# Altium schematic sheet RS485_RS232_Sheet.SchDoc
size 420 x 297 mm; DocumentNumber: 5; SheetNumber: 5; SheetTotal: 14
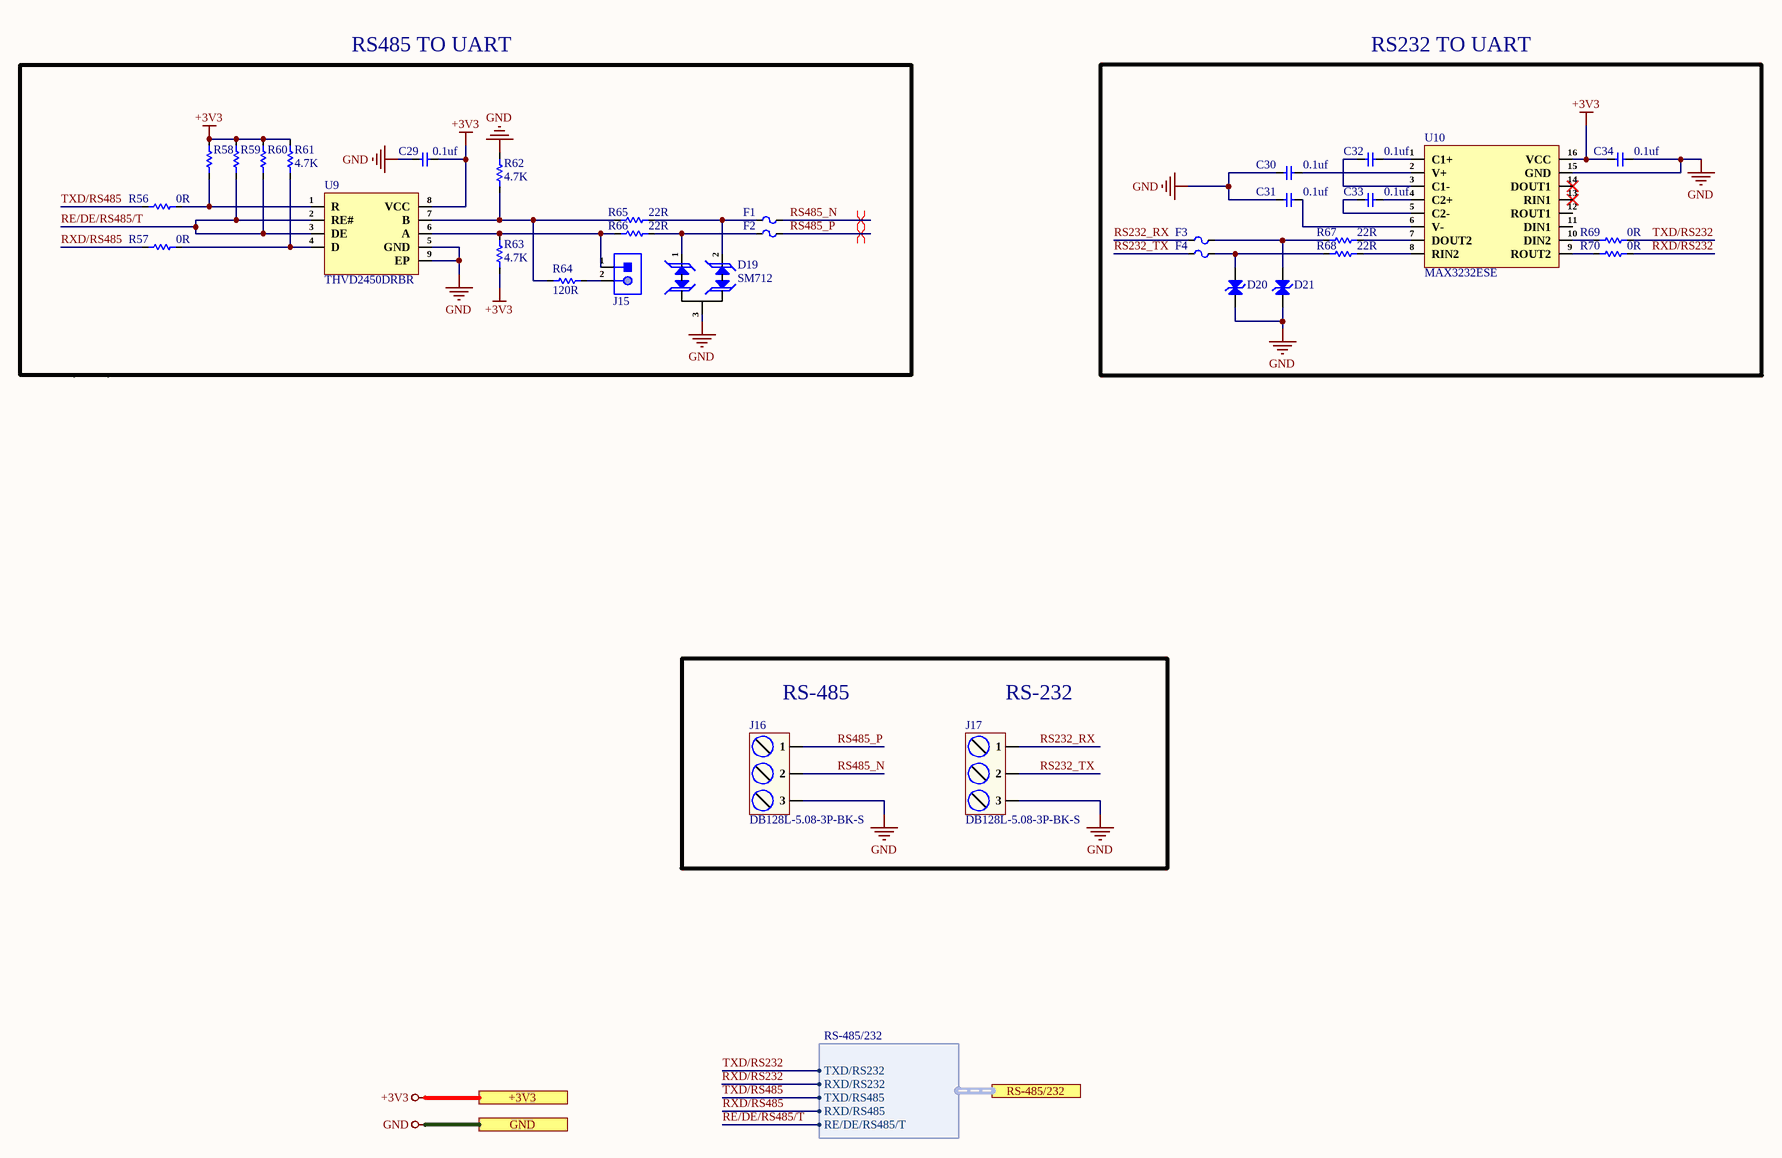
[diagram p0: RS485_RS232_Sheet.SchDoc]

## Parts
C29  0.1uf  [Cap-0402]
C30  0.1uf  [Cap-0402]
C31  0.1uf  [Cap-0402]
C32  0.1uf  [Cap-0402]
C33  0.1uf  [Cap-0402]
C34  0.1uf  [Cap-0402]
D19  SM712  [SOT-23]
D20  SMBJ8.0CA  [SMB Bi Directional]  (value not drawn)
D21  SMBJ8.0CA  [SMB Bi Directional]  (value not drawn)
F1  MF-MSMF010-2  [Fuse-1812_]  (value not drawn)
F2  MF-MSMF010-2  [Fuse-1812_]  (value not drawn)
F3  MF-MSMF010-2  [Fuse-1812_]  (value not drawn)
F4  MF-MSMF010-2  [Fuse-1812_]  (value not drawn)
J15  X6511WV-02H-C60D30  [HDR1X2_]  (value not drawn)
J16  DB128L-5.08-3P-BK-S  [DB128L-5.08-3P-BK-S]
J17  DB128L-5.08-3P-BK-S  [DB128L-5.08-3P-BK-S]
R56  0R  [Res-0402]
R57  0R  [Res-0402]
R58  4.7K  [Res-0402]  (value not drawn)
R59  4.7K  [Res-0402]  (value not drawn)
R60  4.7K  [Res-0402]  (value not drawn)
R61  4.7K  [Res-0402]
R62  4.7K  [Res-0402]
R63  4.7K  [Res-0402]
R64  120R  [Res-0603]
R65  22R  [Res-0201]
R66  22R  [Res-0201]
R67  22R  [Res-0201]
R68  22R  [Res-0201]
R69  0R  [Res-0402]
R70  0R  [Res-0402]
U9  THVD2450DRBR  [SON-8-EP(3x3)]
U10  MAX3232ESE  [SOP-16]

## Ports
+3V3 (see Top-Sheet[1B], CAN_Sheet[5D], Controller_Sheet[5D], EtherCAT_Sheet[5D], Power_Sheet[5D], Stepper_Driver_Sheet[5D]), GND (see Top-Sheet[1B], CAN_Sheet[5D], Controller_Sheet[5D], EtherCAT_Sheet[5D], Ext_Stepper_Driver_Sheet[5D], Power_Sheet[5D], Stepper_Driver_Sheet[5D]), RS-485/232 (harness RS-485/232, see Top-Sheet[2B], Controller_Sheet[4D])

## Harnesses
RS-485/232: TXD/RS232, RXD/RS232, TXD/RS485, RXD/RS485, RE/DE/RS485/T

## Nets
+3V3: C29.2 C34.2 R58.2 R59.2 R60.2 R61.2 R63.1 U9.8(VCC) U10.16(VCC) ; port +3V3
GND: C29.1 C30.1 C31.1 C34.1 D19.3(GND) D20.1(A) D21.1(A) J16.3 J17.3 R62.2 U9.5(GND) U9.9(EP) U10.15(GND) ; port GND
RE/DE/RS485/T: R59.1 R60.1 U9.2(RE#) U9.3(DE) ; port RS-485/232.RE/DE/RS485/T
RS232_RX: F3.1 J17.1
RS232_TX: F4.1 J17.2
RS485_N: F1.2 J16.2
RS485_P: F2.2 J16.1
RXD/RS232: R70.2 ; port RS-485/232.RXD/RS232
RXD/RS485: R57.1 ; port RS-485/232.RXD/RS485
TXD/RS232: R69.2 ; port RS-485/232.TXD/RS232
TXD/RS485: R56.1 ; port RS-485/232.TXD/RS485
NetC30_2: C30.2 U10.2(V+)
NetC31_2: C31.2 U10.6(V-)
NetC32_1: C32.1 U10.1(C1+)
NetC32_2: C32.2 U10.3(C1-)
NetC33_1: C33.1 U10.4(C2+)
NetC33_2: C33.2 U10.5(C2-)
NetD19_1: D19.1(I/O1) F2.1 R66.2
NetD19_2: D19.2(I/O2) F1.1 R65.2
NetD20_2: D20.2(A) F4.2 R68.1
NetD21_2: D21.2(A) F3.2 R67.1
NetJ15_1: J15.1 R63.2 R66.1 U9.6(A)
NetJ15_2: J15.2 R64.2
NetR56_2: R56.2 R58.1 U9.1(R)
NetR57_2: R57.2 R61.1 U9.4(D)
NetR62_1: R62.1 R64.1 R65.1 U9.7(B)
NetR67_2: R67.2 U10.7(DOUT2)
NetR68_2: R68.2 U10.8(RIN2)
NetR69_1: R69.1 U10.10(DIN2)
NetR70_1: R70.1 U10.9(ROUT2)

Not connected (* = marked no-connect by the designer): U10 11(DIN1) 12(ROUT1) 13(RIN1)* 14(DOUT1)*

## Layout directives
differential pair; net class RS485; differential pair class RS485_LINES; rule Impedance Constraint [Min = 115.0    Max = 125.0    ]; rule Matched Net Lengths [Tolerance = 0.508mm]: RS485_N, RS485_P

## Notes on the sheet
- RS485 TO UART
- RS232 TO UART
- (near J16) RS-485
- (near J17) RS-232
- File:
- Title:
- Date:
- Page
- Num:
- Total:
- Drawn By: Huzaifa Ali

## Library data of the parts
C29-C34 = GRM155R62A104KE14D: CAP CER 0.1UF 100V X5R 0402; Manufacturer: Murata; Capacitance: 100nF; Tolerance: 10%; Item Type: Capacitor; Supplier 1: Arrow Electronics; Manufacturer Part Number: GRM155R62A104KE14D; RoHS: Yes; Category: Ceramic Capacitors; Stock 1: 870000; Pricing 1: 10000=0.00500, 20000=0.00410, 30000=0.00390, 50000=0.00370, 100000=0.00300 (USD); Mount: Surface Mount; Case/Package: 0402; Case Code (Metric): 1005; Case Code (Imperial): 0402; Weight: 0.000212oz; Min Operating Temperature: -55°C; Max Operating Temperature: 85°C; Packaging: Tape and Reel; Voltage Rating: 100V; Dielectric: X5R; Termination: SMD/SMT; Voltage Rating (DC): 100V; Package Quantity: 10000; Series: GRM; Length: 0.039inch; Width: 0.02inch; Height: 0.5mm; Thickness: 0.022inch; Reach SVHC Compliant: Yes; Lead Free: Lead Free; RoHS Compliant: Yes; ComponentLink1URL: http://www.farnell.com/datasheets/2079151.pdf?src-supplier=Farnell; ComponentLink1Description: http://www.farnell.com/datasheets/2079151.pdf?src-supplier=Farnell; ComponentLink2URL: http://www.mouser.com/ds/2/281/c02e-2905.pdf?src-supplier=Mouser; ComponentLink2Description: http://www.mouser.com/ds/2/281/c02e-2905.pdf?src-supplier=Mouser; ComponentLink3URL: http://www.farnell.com/datasheets/2079151.pdf?src-supplier=Element14; ComponentLink3Description: http://www.farnell.com/datasheets/2079151.pdf?src-supplier=Element14; ComponentLink4URL: http://search.murata.co.jp/Ceramy/image/img/A01X/G101/ENG/GRM155R62A104KE14-01.pdf?src-supplier=Digi-Key; ComponentLink4Description: http://search.murata.co.jp/Ceramy/image/img/A01X/G101/ENG/GRM155R62A104KE14-01.pdf?src-supplier=Digi-Key; ComponentLink5URL: http://www.farnell.com/datasheets/2079151.pdf?src-supplier=Newark; ComponentLink5Description: http://www.farnell.com/datasheets/2079151.pdf?src-supplier=Newark; Supplier Part Number 1: GRM155R62A104KE14D; LCSC Part Number: C162178
D19 = SM712: SOT-23 TVS ROHS; Manufacturer: TECH PUBLIC; Item Type: Diode; Manufacturer Part Number: SM712; Package: SOT-23; LCSC Part Number: C521963; ComponentLink1Description: LCSC; ComponentLink1URL: https://www.lcsc.com/product-detail/TVS_TECH-PUBLIC-SM712_C521963.html
D20 D21 = SMBJ8.0CA: TVS DIODE 8VWM 13.6VC DO214AA; Manufacturer: Littelfuse; Item Type: TVS Diodes; Peak Pulse Power: 600W; Clamping Voltage: 13.6V; Reverse Standoff Voltage: 8V; Peak Pulse Current: 44.2A; Test Current: 1mA; Polarity: Bidirectional; Number of Bidirectional Channels: 1; Min Breakdown Voltage: 8.89V; Power Line Protection: No; Leakage Current: 100uA; Diode Type: ZENER; Max Breakdown Voltage: 9.83V; Supplier: Digikey; LCSC Part Number: C224029; Manufacturer Part Number: SMBJ8.0CA; RoHS: Yes; Stock: 5825; Pricing: 1=0.52, 10=0.321, 100=0.2038, 500=0.15312, 1000=0.13674 (USD); Mounting Technology: Surface Mount; Case/Package: DO-214AA; Pins: 2; Min Operating Temperature: -65°C; Max Operating Temperature: 150°C; Packaging: Cut Tape; Reverse Breakdown Voltage: 8.89V; Number of Elements: 1; Series: SMBJ; Direction: Bidirectional; Voltage Rating (DC): 8V; Max Power Dissipation: 600W; Power Dissipation: 600W; Clamping Voltage-Max: 13.6V; Length: 5.59mm; Width: 3.94mm; Height: 2.44mm; RoHS Compliant: Yes; Lead Free: Lead Free; Reach SVHC Compliant: No; ComponentLink1URL: https://datasheet.ciiva.com/8062/littelfuse-tvs-diode-smbj-8062558.pdf?src-supplier=Element14; ComponentLink1Description: https://datasheet.ciiva.com/8062/littelfuse-tvs-diode-smbj-8062558.pdf?src-supplier=Element14; ComponentLink2URL: https://datasheet.ciiva.com/331/littelfuse-tvs-diode-smbj-datasheet-pdf-331629.pdf?src-supplier=Digikey; ComponentLink2Description: https://datasheet.ciiva.com/331/littelfuse-tvs-diode-smbj-datasheet-pdf-331629.pdf?src-supplier=Digikey; ComponentLink3URL: https://datasheet.ciiva.com/331/littelfuse-tvs-diode-smbj-datasheet-pdf-331630.pdf?src-supplier=Digikey; ComponentLink3Description: https://datasheet.ciiva.com/331/littelfuse-tvs-diode-smbj-datasheet-pdf-331630.pdf?src-supplier=Digikey; ComponentLink4URL: https://datasheet.ciiva.com/331/littelfuse-tvs-diode-smbj-datasheet-pdf-331628.pdf?src-supplier=Digikey; ComponentLink4Description: https://datasheet.ciiva.com/331/littelfuse-tvs-diode-smbj-datasheet-pdf-331628.pdf?src-supplier=Digikey
F1-F4 = MF-MSMF010-2: 60V 100mA 40A 300mA 1812 Resettable Fuses ROHS; Manufacturer: Bourns; Time to Trip: 1.5s; Item Type: Fuse; Supplier 1: Arrow Electronics; Manufacturer Part Number: MF-MSMF010-2; RoHS: Yes; Category: Fuses; Stock 1: 75000; Pricing 1: 3000=0.1392 (USD); Mounting Technology: Surface Mount; Case Code (Imperial): 1812; Case Code (Metric): 4532; Min Operating Temperature: -40°C; Max Operating Temperature: 85°C; Packaging: Cut Tape; Max Current Rating: 40A; Hold Current: 100mA; Trip Current: 300mA; Series: Multifuse®, MF-MSMF; Voltage Rating: 60V; Ratings: AEC-Q200; RoHS Compliant: Yes; ComponentLink1URL: http://www.farnell.com/datasheets/2264697.pdf?src-supplier=Farnell; ComponentLink1Description: http://www.farnell.com/datasheets/2264697.pdf?src-supplier=Farnell; ComponentLink2URL: http://www.farnell.com/datasheets/2264697.pdf?src-supplier=Newark; ComponentLink2Description: http://www.farnell.com/datasheets/2264697.pdf?src-supplier=Newark; ComponentLink3URL: http://www.farnell.com/datasheets/2264697.pdf?src-supplier=Element14; ComponentLink3Description: http://www.farnell.com/datasheets/2264697.pdf?src-supplier=Element14; ComponentLink4URL: http://www.farnell.com/datasheets/1786007.pdf?src-supplier=Newark; ComponentLink4Description: http://www.farnell.com/datasheets/1786007.pdf?src-supplier=Newark; ComponentLink5URL: https://www.bourns.com/docs/Product-Datasheets/mfmsmf.pdf?src-supplier=Digi-Key; ComponentLink5Description: https://www.bourns.com/docs/Product-Datasheets/mfmsmf.pdf?src-supplier=Digi-Key; Supplier Part Number 1: MF-MSMF010-2; LCSC Part Number: C12430
J15 = X6511WV-02H-C60D30: Gold 250V 3A Straight Square Pins 2.5mm 2P 260℃ 6mm -40℃~+105℃ 3mm 2.54mm Plugin Black Brass 1x2P Plugin,P=2.54mm Pin Headers ROHS; Manufacturer: XKB; Item Type: Male Header; Manufacturer Part Number: X6511WV-02H-C60D30; Package: Plugin,P=2.54mm; LCSC Part Number: C706874; ComponentLink1Description: LCSC; ComponentLink1URL: https://www.lcsc.com/product-detail/Pin-Headers_XKB-Connectivity-X6511WV-02H-C60D30_C706874.html
J16 J17 = DB128L-5.08-3P-BK-S: 1x3P 18A -40℃~+105℃ 250V Black 12~30 Straight pin 5.08mm 2.5 1 3 Plugin,P=5.08mm Screw terminal ROHS; Manufacturer: DIBO; Item Type: Terminal Block; Manufacturer Part Number: DB128L-5.08-3P-BK-S; Package: Plugin,P=5.08mm; LCSC Part Number: C430602; ComponentLink1Description: LCSC; ComponentLink1URL: https://www.lcsc.com/product-detail/Screw-terminal_DIBO-DB128L-5-08-3P-BK-S_C430602.html
R56 R57 R69 R70 = RC0402FR-070RL: RES 0 OHM JUMPER 1/16W 0402; Manufacturer: Yageo; Item Type: Resistors; Tolerance: 1%; Power Rating: 62.5mW; Voltage Rating: 50V; Temperature Coefficient: 200ppm/°C; Max Power Dissipation: 63mW; Supplier 1: Mouser; Manufacturer Part Number: RC0402FR-070RL; RoHS: Yes; Stock 1: 8556842; Pricing 1: 1=0.10000, 10=0.01400, 50=0.01400, 100=0.00600, 1000=0.00300, 5000=0.00200, 10000=0.00100 (USD); Mount: Surface Mount; Case/Package: 0402; Contact Plating: Tin,Matte; Case Code (Imperial): 0402; Case Code (Metric): 1005; Size Code: 0402; Min Operating Temperature: -55°C; Max Operating Temperature: 155°C; Resistance: 0R; Resistor Type: Thick Film; Packaging: Tape and Reel; Termination: SMD/SMT; Features: Moisture Resistant; Series: RC; Number of Terminations: 2; Length: 1mm; Width: 0.5mm; Height: 0.35mm; Radiation Hardening: No; Lead Free: Lead Free; RoHS Compliant: Yes; ComponentLink1URL: https://datasheet.ciiva.com/8896/pyu-rc0402-51-rohs-l-6-8896149.pdf?src-supplier=Avnet; ComponentLink1Description: https://datasheet.ciiva.com/8896/pyu-rc0402-51-rohs-l-6-8896149.pdf?src-supplier=Avnet; ComponentLink2URL: https://datasheet.ciiva.com/16790/pyu-rc0402-51-rohs-l-6-r-16790444.pdf?src-supplier=Future+Electronics; ComponentLink2Description: https://datasheet.ciiva.com/16790/pyu-rc0402-51-rohs-l-6-r-16790444.pdf?src-supplier=Future+Electronics; Supplier Part Number 1: 603-RC0402FR-070RL; LCSC Part Number: C106231
R58-R63 = RC0402FR-074K7L: RES 4.7K OHM 1% 1/16W 0402; Manufacturer: Yageo; Voltage Rating (DC): 50V; Power Rating: 62.5mW; Resistance: 4.7kR; Temperature Coefficient: 100ppm/°C; Max Power Dissipation: 63mW; Item Type: Resistor; Supplier 1: Avnet; Manufacturer Part Number: RC0402FR-074K7L; RoHS: Yes; Category: Chip SMD Resistors; Stock 1: 2420000; Pricing 1: 10000=0.00085 (USD); Case/Package: 0402; Number of Pins: 2; Case Code (Imperial): 0402; Case Code (Metric): 1005; Size Code: 0402; Min Operating Temperature: -55°C; Max Operating Temperature: 155°C; Tolerance: 1%; Voltage Rating: 50V; Packaging: Tape and Reel; Resistor Type: Thick Film; Termination: SMD/SMT; Features: Moisture Resistant; Series: RC; Number of Terminations: 2; Resistance Tolerance: 1%; Construction: Rectangular; Length: 1mm; Width: 0.5mm; Height: 0.32mm; Depth: 0.5mm; Height - Seated (Max): 0.016inch; RoHS Compliant: Yes; Reach SVHC Compliant: Yes; Military Standard: Not; Lead Free: Lead Free; ComponentLink1URL: https://datasheet.ciiva.com/22661/1686128-22661342.pdf?src-supplier=Element14; ComponentLink1Description: https://datasheet.ciiva.com/22661/1686128-22661342.pdf?src-supplier=Element14; ComponentLink2URL: https://datasheet.ciiva.com/7850/1018594-7850022.pdf?src-supplier=Element14; ComponentLink2Description: https://datasheet.ciiva.com/7850/1018594-7850022.pdf?src-supplier=Element14; ComponentLink3URL: https://datasheet.ciiva.com/7850/1018594-7850023.pdf?src-supplier=Element14; ComponentLink3Description: https://datasheet.ciiva.com/7850/1018594-7850023.pdf?src-supplier=Element14; ComponentLink4URL: https://datasheet.ciiva.com/15215/getdatasheetpartid-328119-15215035.pdf?src-supplier=Verical; ComponentLink4Description: https://datasheet.ciiva.com/15215/getdatasheetpartid-328119-15215035.pdf?src-supplier=Verical; Supplier Part Number 1: RC0402FR-074K7L; LCSC Part Number: C105871
R64 = RC0603JR-07120RL: RES 120 OHM 5% 1/10W 0603; Manufacturer: Yageo; Voltage Rating (AC): 50V; Item Type: Resistor; Supplier: Future Electronics; Supplier Part Number: 4045720; Manufacturer Part Number: RC0603JR-07120RL; RoHS: Yes; Category: Chip SMD Resistors; Stock: 570000; Pricing: 5000=0.0015, 75000=0.0015, 250000=0.0014, 750000=0.0013, 2500000=0.0012 (USD); ComponentLink1URL: https://datasheet.ciiva.com/15189/getdatasheetpartid-326532-15189850.pdf?src-supplier=Verical; ComponentLink1Description: https://datasheet.ciiva.com/15189/getdatasheetpartid-326532-15189850.pdf?src-supplier=Verical; ComponentLink2URL: https://datasheet.ciiva.com/2518/pyu-r-int-thick-7-2518850.pdf?src-supplier=Digi-Key; ComponentLink2Description: https://datasheet.ciiva.com/2518/pyu-r-int-thick-7-2518850.pdf?src-supplier=Digi-Key; ComponentLink3URL: https://datasheet.ciiva.com/2518/pyu-r-int-thick-7-2518851.pdf?src-supplier=Digi-Key; ComponentLink3Description: https://datasheet.ciiva.com/2518/pyu-r-int-thick-7-2518851.pdf?src-supplier=Digi-Key; ComponentLink4URL: https://datasheet.ciiva.com/2518/pyu-r-int-thick-7-2518852.pdf?src-supplier=Digi-Key; ComponentLink4Description: https://datasheet.ciiva.com/2518/pyu-r-int-thick-7-2518852.pdf?src-supplier=Digi-Key; ComponentLink5URL: https://datasheet.ciiva.com/46395/443971-46395070.pdf?src-supplier=Element14; ComponentLink5Description: https://datasheet.ciiva.com/46395/443971-46395070.pdf?src-supplier=Element14; ComponentLink6URL: https://datasheet.ciiva.com/12555/rc0603-272842-12555246.pdf?src-supplier=Mouser; ComponentLink6Description: https://datasheet.ciiva.com/12555/rc0603-272842-12555246.pdf?src-supplier=Mouser; LCSC Part Number: C114681
R65-R68 = RC0201FR-0722RL: RES 22 OHM 1% 1/20W 0201; Manufacturer: Yageo; Item Type: Resistor; Supplier: Future Electronics; Supplier Part Number: 5973409; Manufacturer Part Number: RC0201FR-0722RL; RoHS: Yes; Category: Chip SMD Resistors; Stock: 17980000; Pricing: 10000=0.0014, 50000=0.0013, 250000=0.0013, 750000=0.0012, 2000000=0.0011 (USD); ComponentLink1URL: https://datasheet.ciiva.com/7672/1563626-7672215.pdf?src-supplier=Element14; ComponentLink1Description: https://datasheet.ciiva.com/7672/1563626-7672215.pdf?src-supplier=Element14; LCSC Part Number: C155743
U9 = THVD2450DRBR: IC TRANSCEIVER HALF 1/1 8SON; Manufacturer: Texas Instruments; Supplier: Digikey; Supplier Part Number: 296-THVD2450DRBRCT-ND; Manufacturer Part Number: THVD2450DRBR; RoHS: Yes; Item Type: IC; Stock: 2652; Pricing: 1=4.05, 10=3.639, 25=3.4404, 100=2.9818, 250=2.82892, 500=2.53838, 1000=2.1408 (USD); Pins: 8NUMBER; Length: 3mm; Width: 3mm; Height: 1mm; Thickness: 880um; LCSC Part Number: C2878080
U10 = MAX3232ESE: 250Kbps transceiver 2/2 SOP-16 RS232 ICs ROHS; Manufacturer: UMW; Item Type: IC; Manufacturer Part Number: MAX3232ESE; Package: SOP-16; LCSC Part Number: C2904738; ComponentLink1Description: LCSC; ComponentLink1URL: https://www.lcsc.com/product-detail/RS232-ICs_UMW-Youtai-Semiconductor-Co-Ltd-MAX3232ESE_C2904738.html